# Altium project Mach_cam_bien_V2.PrjPcb
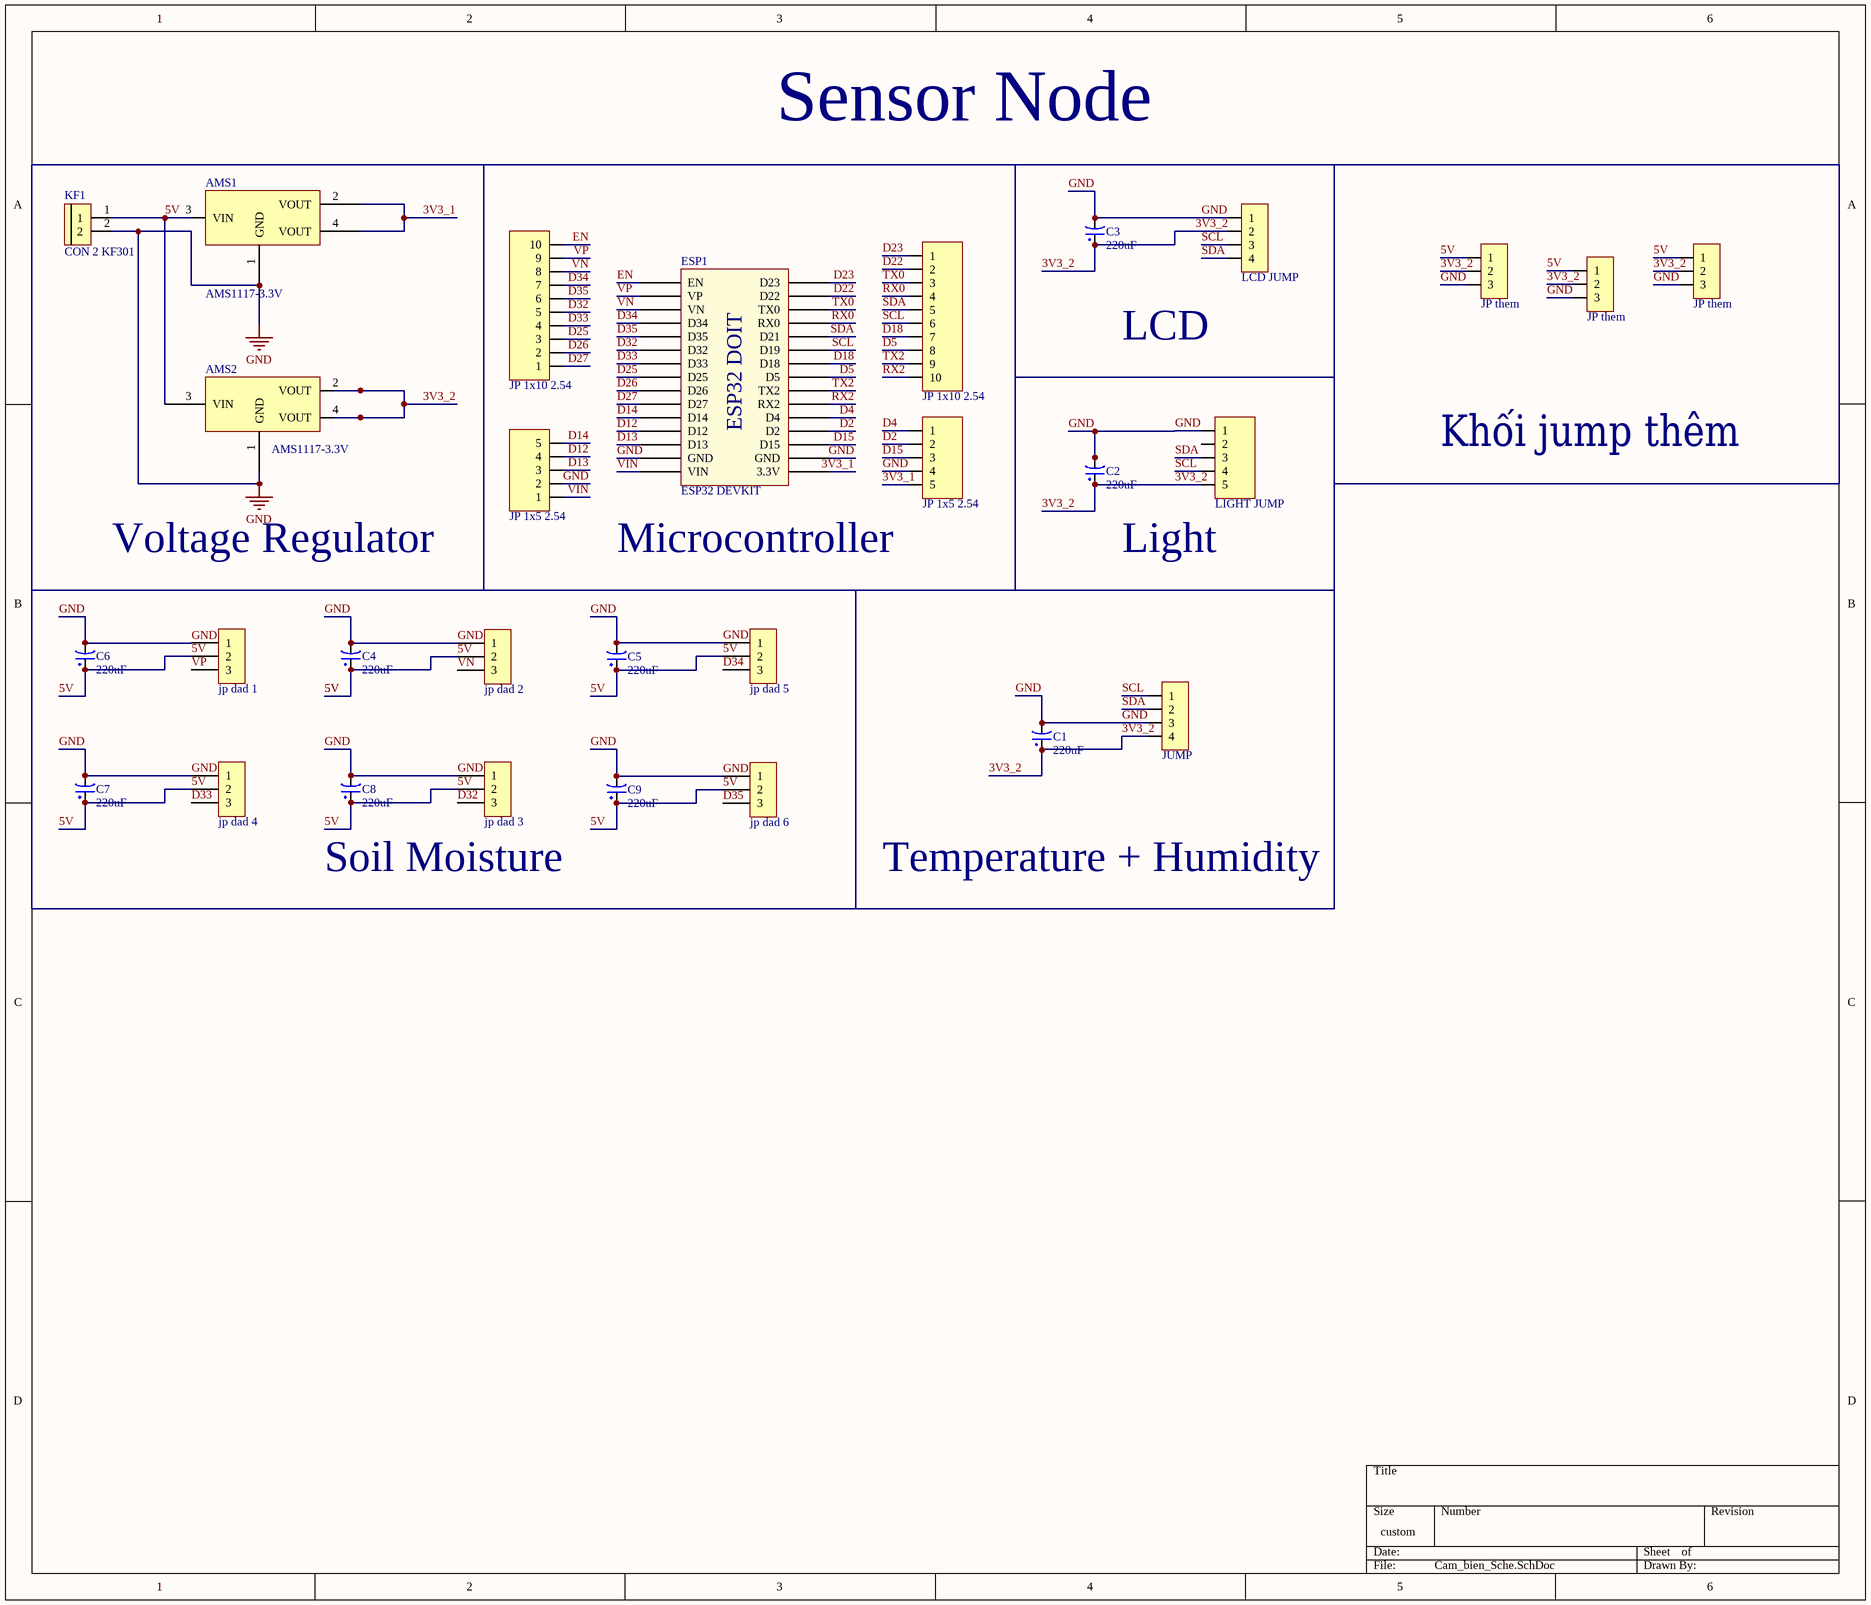
[diagram p0: Cam_bien_Sche.SchDoc]
1 sheet, 29 parts. Net scope: global (net labels, ports and power ports of the same name join across sheets).
Board file: Mach_CB.PcbDoc

## Sheet Cam_bien_Sche.SchDoc
size 350 x 299 mm; SheetNumber: 1; SheetTotal: 1

### Parts
(Parts that share a designator on the sheet are numbered #1, #2 ... from top to bottom, then left to right.)
AMS1  AMS1117-3.3V  [SOT223]
AMS2  AMS1117-3.3V  [SOT223]
C1  220uF  [tu hoa 5mm]
C2  220uF  [tu hoa 5mm]
C3  220uF  [tu hoa 5mm]
C4  220uF  [tu hoa 5mm]
C5  220uF  [tu hoa 5mm]
C6  220uF  [tu hoa 5mm]
C7  220uF  [tu hoa 5mm]
C8  220uF  [tu hoa 5mm]
C9  220uF  [tu hoa 5mm]
ESP1  ESP32 DEVKIT  [ESP32 WROOM 32 KIT]
H1  jp dad 1  [Header 3P DC 2.54]
H2  jp dad 2  [Header 3P DC 2.54]
H3  jp dad 5  [Header 3P DC 2.54]
H4  jp dad 4  [Header 3P DC 2.54]
H5  jp dad 3  [Header 3P DC 2.54]
H6  jp dad 6  [Header 3P DC 2.54]
JP1  JP 1x10 2.54  [JP 1x10 DT]
JP2  JP 1x10 2.54  [JP 1x10 DT]
JP3  JUMP  [JP 1x4 DT]
JP4  JP 1x5 2.54  [JP 1x5 DT]
JP5  JP 1x5 2.54  [JP 1x5 DT]
JP6  LIGHT JUMP  [JP 1x5 DT]
JP9  LCD JUMP  [JP 1x4 DT]
JP?#1  JP them  [JP 1x3 DT]
JP?#2  JP them  [JP 1x3 DT]
JP?#3  JP them  [JP 1x3 DT]
KF1  CON 2 KF301  [Con 2 KF301 5.08]

### Nets
GND: AMS1.1(GND) AMS2.1(GND) C1.2 C2.2 C3.2 C4.2 C5.2 C6.2 C7.2 C8.2 C9.2 ESP1.14(GND) ESP1.17(GND) H1.1 H2.1 H3.1 H4.1 H5.1 H6.1 JP3.3 JP4.4 JP5.2 JP6.1 JP9.1 JP?#1.3 JP?#2.3 JP?#3.3 KF1.2
3V3_1: AMS1.2(VOUT) AMS1.4(VOUT) ESP1.16(3.3V) JP4.5
3V3_2: AMS2.2(VOUT) AMS2.4(VOUT) C1.1 C2.1 C3.1 JP3.4 JP6.5 JP9.2 JP?#1.2 JP?#2.2 JP?#3.2
5V: AMS1.3(VIN) AMS2.3(VIN) C4.1 C5.1 C6.1 C7.1 C8.1 C9.1 H1.2 H2.2 H3.2 H4.2 H5.2 H6.2 JP?#1.1 JP?#2.1 JP?#3.1 KF1.1
D2: ESP1.19(D2) JP4.2
D4: ESP1.20(D4) JP4.1
D5: ESP1.23(D5) JP2.8
D12: ESP1.12(D12) JP5.4
D13: ESP1.13(D13) JP5.3
D14: ESP1.11(D14) JP5.5
D15: ESP1.18(D15) JP4.3
D18: ESP1.24(D18) JP2.7
D22: ESP1.29(D22) JP2.2
D23: ESP1.30(D23) JP2.1
D25: ESP1.8(D25) JP1.3
D26: ESP1.9(D26) JP1.2
D27: ESP1.10(D27) JP1.1
D32: ESP1.6(D32) H5.3 JP1.5
D33: ESP1.7(D33) H4.3 JP1.4
D34: ESP1.4(D34) H3.3 JP1.7
D35: ESP1.5(D35) H6.3 JP1.6
EN: ESP1.1(EN) JP1.10
RX0: ESP1.27(RX0) JP2.4
RX2: ESP1.21(RX2) JP2.10
SCL: ESP1.25(D19) JP2.6 JP3.1 JP6.4 JP9.3
SDA: ESP1.26(D21) JP2.5 JP3.2 JP6.3 JP9.4
TX0: ESP1.28(TX0) JP2.3
TX2: ESP1.22(TX2) JP2.9
VIN: ESP1.15(VIN) JP5.1
VN: ESP1.3(VN) H2.3 JP1.8
VP: ESP1.2(VP) H1.3 JP1.9

Not connected (* = marked no-connect by the designer): JP6 2

### Notes on the sheet
- Sensor Node
- LCD
- Khối jump thêm
- Voltage Regulator
- Microcontroller
- Light
- Soil Moisture
- Temperature + Humidity
- (in symbol ESP32 WROOM 32 KIT) ESP32 DOIT

### Library data of the parts
AMS1 AMS2 = AMS1117 SMD: Dán; Value: AMS1117-3.3V SOT223; Don_Vi: Con; Ma_Hang: MH000596; Ghi_Chu: *; Kieu_Chan: *; Chung_Loai: Dán
C1-C9 = Tu Hoa 220uF 10V 6x11: Cắm; Don_Vi: Con; So_Chan: 2; Ten_Linh_Kien: Tụ Hóa 220uF 10V 6x11MM; Ma_Hang: MH004510; Chung_Loai: Cắm; Kieu_Chan: *
ESP1 = ESP32 WROOM 32 KIT
H1-H6 = Header 3P 2.54 Duc Cong: Cắm; Ten_Linh_Kien: Header 3P XH2.54-3P Đực Cong; Don_Vi: Con; Ma_Hang: MH001302; Chung_Loai: Cắm
JP1 JP2 = JP 1x10 2.54 Duc Thang: Cắm; Ten_Linh_Kien: Jump Đơn Đực 2.54MM 1x40P Thẳng 11MM; Don_Vi: Con; Ma_Hang: MH000903; Ghi_Chu: *; Kieu_Chan: *; Chung_Loai: Cắm
JP3 JP9 = JP 1x4 2.54 Duc Thang: Cắm; Ten_Linh_Kien: Jump Đơn Đực 2.54MM 1x40P Thẳng 11MM; Don_Vi: Con; Ma_Hang: MH000903; Ghi_Chu: *; Kieu_Chan: *; Chung_Loai: Cắm
JP4-JP6 = JP 1x5 2.54 Duc Thang: Cắm; Ten_Linh_Kien: Jump Đơn Đực 2.54MM 1x40P Thẳng 11MM; Don_Vi: Con; Ma_Hang: MH000903; Ghi_Chu: *; Kieu_Chan: *; Chung_Loai: Cắm
JP?#1-JP?#3 = JP 1x3 2.54 Duc Thang: Cắm; Ten_Linh_Kien: Jump Đơn Đực 2.54MM 1x40P Thẳng 11MM; Don_Vi: Con; Ma_Hang: MH000903; Ghi_Chu: *; Kieu_Chan: *; Chung_Loai: Cắm
KF1 = CON 2 KF301: Cắm; Ma_Hang: MH000987; Ten_Linh_Kien: CON 2 KF301-2P 5.08MM Xanh Dương; Chung_Loai: Cắm; Ghi_Chu: *; Kieu_Chan: *; Don_Vi: Con